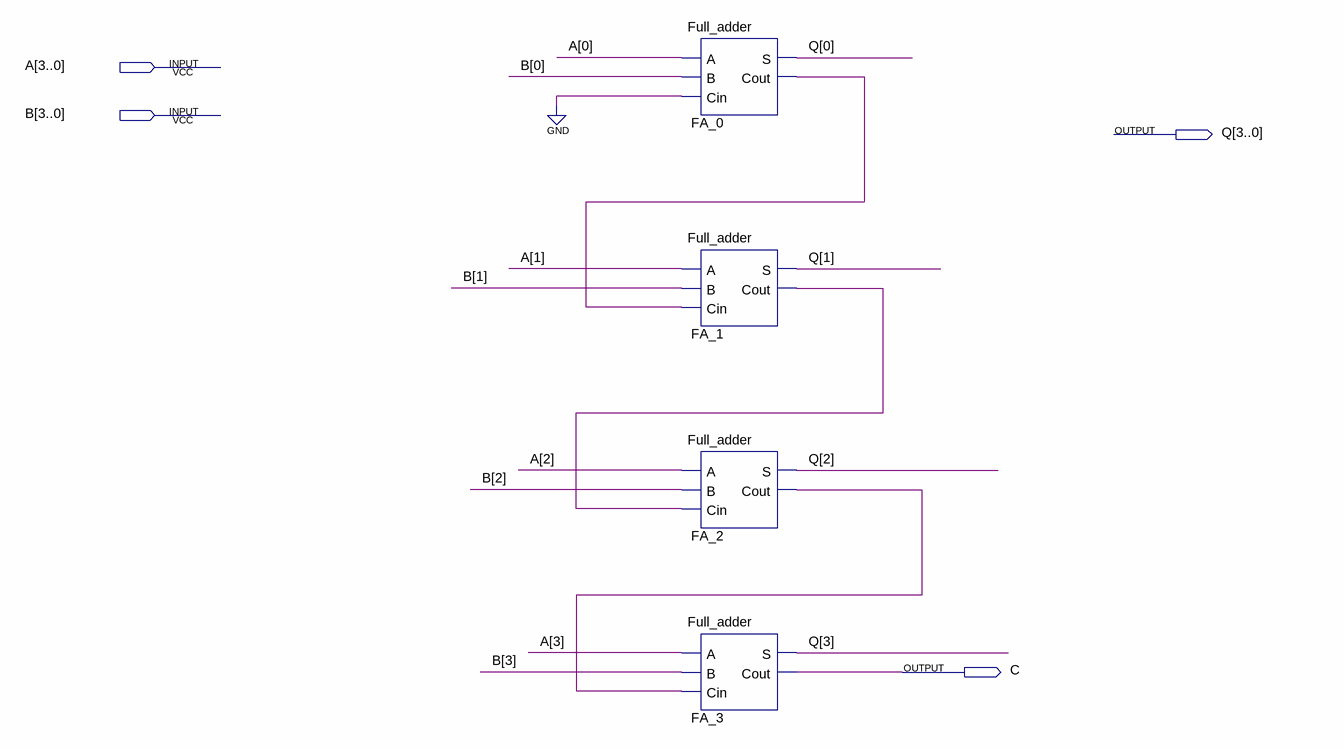
[diagram p0: schematic sheet]
// Quartus schematic Four_bit_adder.bdf as structural Verilog: 4 symbols, 4 pins
module Four_bit_adder (
  input  [3:0] A,
  input  [3:0] B,
  output [3:0] Q,
  output C
);

  wire FA_0_cout, FA_1_cout, FA_2_cout;

  Full_adder FA_0 (.A(A[0]), .B(B[0]), .Cin(1'b0), .S(Q[0]), .Cout(FA_0_cout));
  Full_adder FA_1 (.A(A[1]), .B(B[1]), .Cin(FA_0_cout), .S(Q[1]), .Cout(FA_1_cout));
  Full_adder FA_2 (.A(A[2]), .B(B[2]), .Cin(FA_1_cout), .S(Q[2]), .Cout(FA_2_cout));
  Full_adder FA_3 (.A(A[3]), .B(B[3]), .Cin(FA_2_cout), .S(Q[3]), .Cout(C));
endmodule
